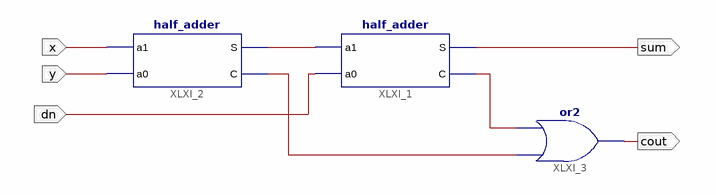
[diagram p0: schematic sheet 1]
// Xilinx ISE schematic full_adder.sch (spartan3) as structural Verilog: 3 symbols, 5 ports
module full_adder (
  input  x,
  input  y,
  input  dn,
  output sum,
  output cout
);

  wire XLXN_1, XLXN_7, XLXN_9;

  half_adder XLXI_1 (.a1(XLXN_1), .a0(dn), .S(sum), .C(XLXN_7));
  half_adder XLXI_2 (.a1(x), .a0(y), .S(XLXN_1), .C(XLXN_9));
  or XLXI_3 (cout, XLXN_9, XLXN_7);
endmodule
